# EAGLE schematic Adafruit ESP32-S3 8MB No PSRAM (EAGLE 9.6.2)
COMPANY: ADAFRUIT INDUSTRIES; DRAWN: KTOWN; REV: B
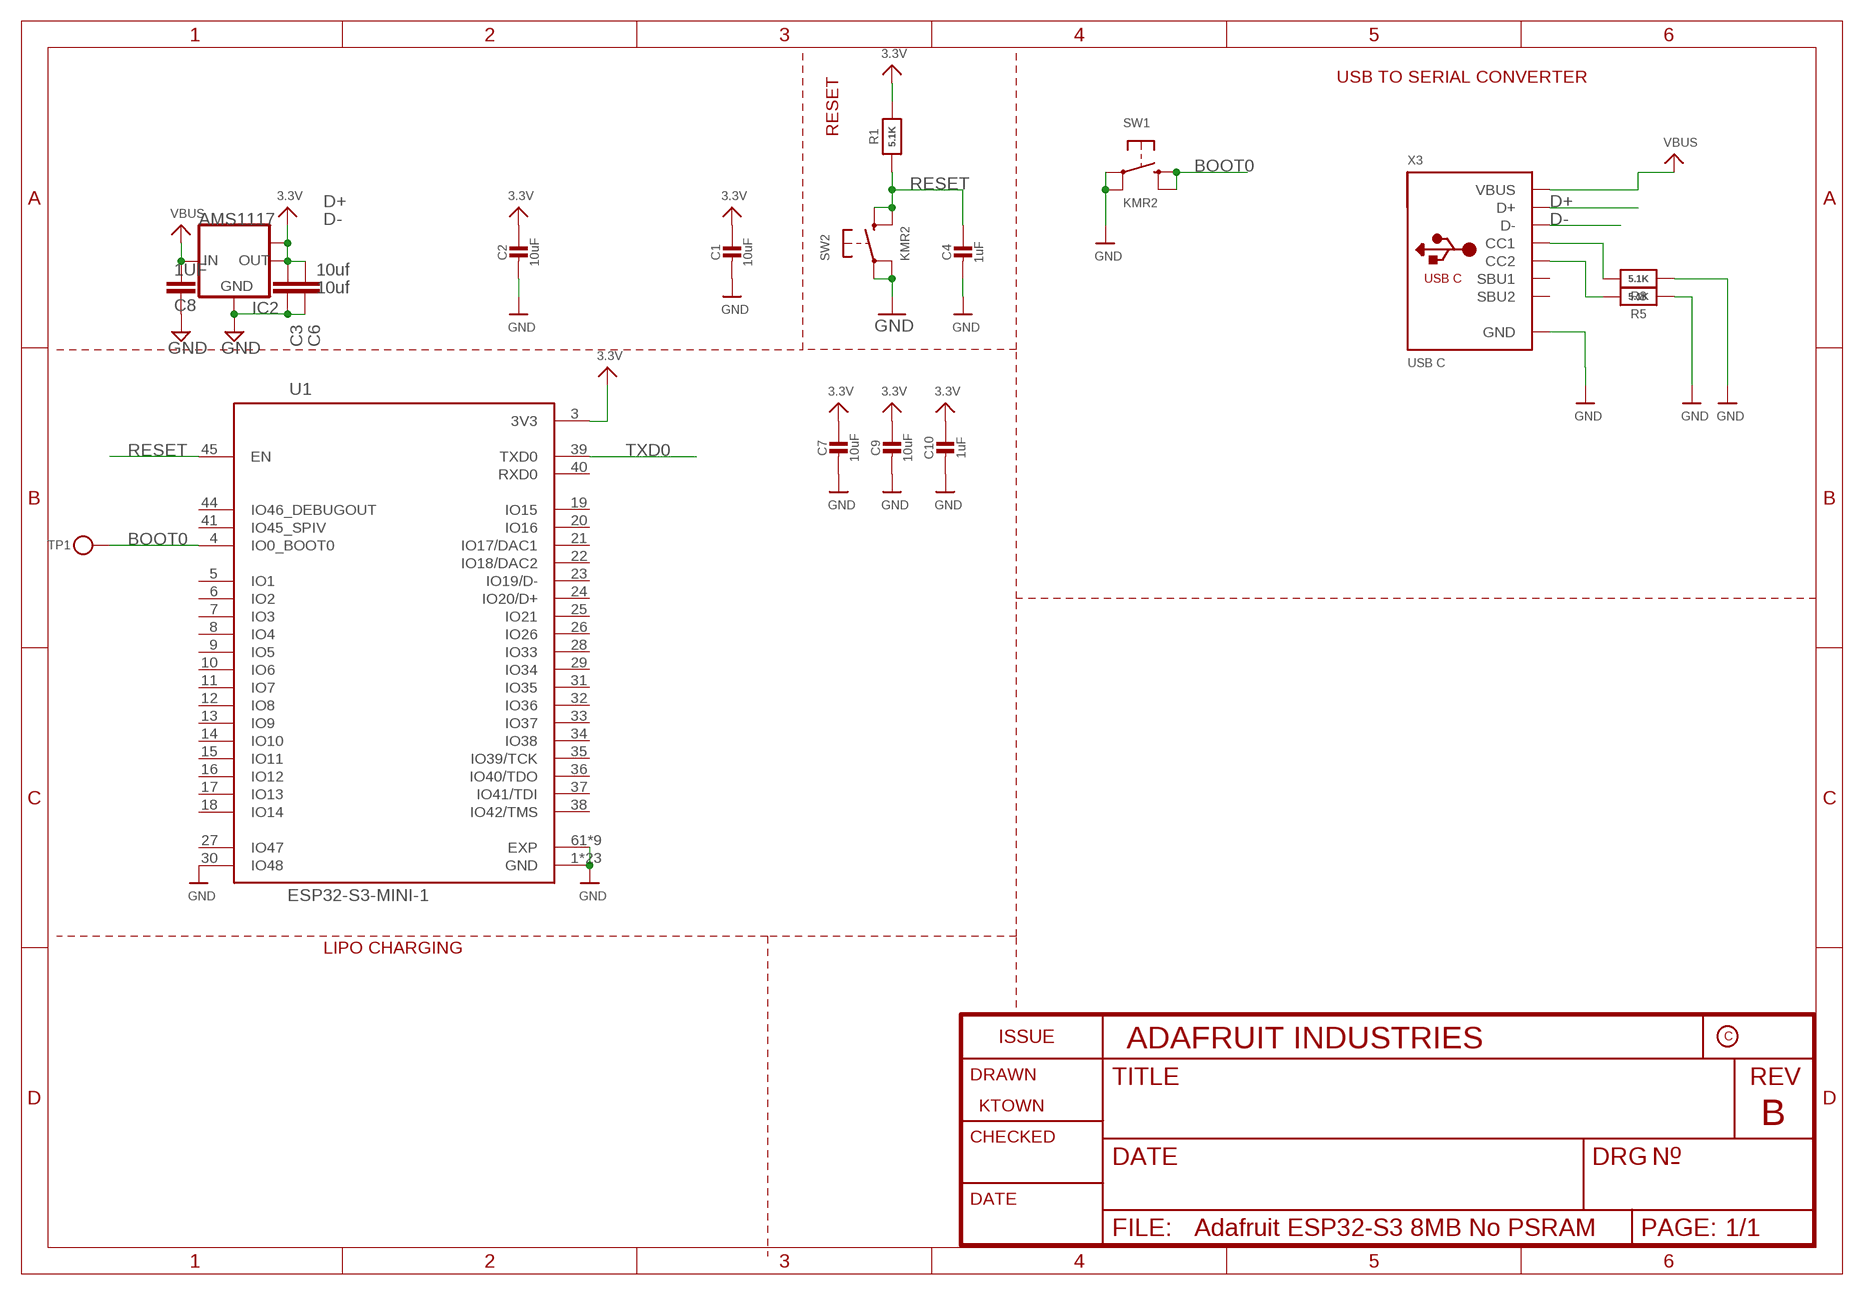
[diagram p0: schematic, sheet 1]

## Parts
C1  10uF  CAP_CERAMIC0805-NOOUTLINE  [0805-NO]
C2  10uF  CAP_CERAMIC0805-NOOUTLINE  [0805-NO]
C3  10uf  C-EUC1206K  [C1206K]
C4  1uF  CAP_CERAMIC0603_NO  [0603-NO]
C6  10uf  C-EUC1206K  [C1206K]
C7  10uF  CAP_CERAMIC0805-NOOUTLINE  [0805-NO]
C8  1UF  C-EUC1206K  [C1206K]
C9  10uF  CAP_CERAMIC0805-NOOUTLINE  [0805-NO]
C10  1uF  CAP_CERAMIC0603_NO  [0603-NO]
IC2  AMS1117  LM1117MPX-5.0  [SOT223]
R1  5.1K  RESISTOR_0603_NOOUT  [0603-NO]
R5  5.1K  RESISTOR_0603_NOOUT  [0603-NO]
R8  5.1K  RESISTOR_0603_NOOUT  [0603-NO]
SW1  KMR2  SWITCH_TACT_SMT4.6X2.8  [BTN_KMR2_4.6X2.8]
SW2  KMR2  SWITCH_TACT_SMT4.6X2.8  [BTN_KMR2_4.6X2.8]
TP1  TESTPOINTROUND1.5MMNO  [TESTPOINT_ROUND_1.5MM_NO]
U1  ESP32-S3-MINI-1  [QFN60_ESP32-S2-MINI-1_EXP]
X3  USB C  USB_C  [USB_C_CUSB31-CFM2AX-01-X]

## Nets
3.3V: C1.1 C2.1 C3.1 C6.1 C7.1 C9.1 C10.1 IC2.2(OUT) IC2.TAB(OUT1) R1.2 U1.3(3V3)
BOOT0: SW1.B'(S1) SW1.B(S) TP1.P$1 U1.4(IO0_BOOT0)
D+: X3.A6(D+) X3.B6(D+)
D-: X3.A7(D-) X3.B7(D-)
GND: C1.2 C2.2 C3.2 C4.2 C6.2 C7.2 C8.2 C9.2 C10.2 IC2.1(GND) R5.1 R8.1 SW1.A'(P1) SW1.A(P) SW2.A'(P1) SW2.A(P) U1.1(GND) U1.2(GND) U1.30(IO48) U1.42(GND) U1.43(GND) U1.46(GND) U1.47(GND) U1.48(GND) U1.49(GND) U1.50(GND) U1.51(GND) U1.52(GND) U1.53(GND) U1.54(GND) U1.55(GND) U1.56(GND) U1.57(GND) U1.58(GND) U1.59(GND) U1.60(GND) U1.61(EXP) U1.62(GND) U1.63(GND) U1.64(GND) U1.65(GND) U1.66(EXP) U1.67(EXP) U1.68(EXP) U1.69(EXP) U1.70(EXP) U1.71(EXP) U1.72(EXP) U1.73(EXP) X3.A1B12(GND) X3.B1A12(GND)
N$8: R8.2 X3.A5(CC1)
N$9: R5.2 X3.B5(CC2)
RESET: C4.1 R1.1 SW2.B'(S1) SW2.B(S) U1.45(EN)
TXD0: U1.39(TXD0)
VBUS [Power]: C8.1 IC2.3(IN) X3.A4B9(VBUS) X3.B4A9(VBUS)
Unconnected: U1.5(IO1) U1.6(IO2) U1.7(IO3) U1.8(IO4) U1.9(IO5) U1.10(IO6) U1.11(IO7) U1.12(IO8) U1.13(IO9) U1.14(IO10) U1.15(IO11) U1.16(IO12) U1.17(IO13) U1.18(IO14) U1.19(IO15) U1.20(IO16) U1.21(IO17/DAC1) U1.22(IO18/DAC2) U1.23(IO19/D-) U1.24(IO20/D+) U1.25(IO21) U1.26(IO26) U1.27(IO47) U1.28(IO33) U1.29(IO34) U1.31(IO35) U1.32(IO36) U1.33(IO37) U1.34(IO38) U1.35(IO39/TCK) U1.36(IO40/TDO) U1.37(IO41/TDI) U1.38(IO42/TMS) U1.40(RXD0) U1.41(IO45_SPIV) U1.44(IO46_DEBUGOUT) X3.A8(SBU1) X3.B8(SBU2)

## Notes on the sheet
- USB TO SERIAL CONVERTER
- RESET
- LIPO CHARGING

## Library data of the parts
C1 C2 C4 C7 C9 C10 = microbuilder:CAP_CERAMIC: Ceramic Capacitors For new designs, use the packages preceded by an '_' character since they are more reliable: The following footprints should be used on most boards: _0402 - Standard footprint for regular board layouts _0603 - Standard footprint for regular board layouts _0805 - Standard footprint for regular board layouts _1206 - Standard footprint for regular board layouts For extremely tight-pitch boards where space is at a premium, the following 'micro-pitch' footprints can be used (smaller pads, no silkscreen outline, etc.): _0402MP - Micro-pitch footprint for very dense/compact boards _0603MP - Micro-pitch footprint for very dense/compact boards _0805MP - Micro-pitch footprint for very dense/compact boards _1206MP - Micro-pitch footprint for very dense/compact boards
C3 C6 C8 = rcl:C-EU: CAPACITOR, European symbol; SPICEPREFIX: C
IC2 = lm1117:LM1117MPX-*
R1 R5 R8 = microbuilder:RESISTOR: Resistors For new designs, use the packages preceded by an '_' character since they are more reliable: The following footprints should be used on most boards: _0402 - Standard footprint for regular board layouts _0603 - Standard footprint for regular board layouts _0805 - Standard footprint for regular board layouts _1206 - Standard footprint for regular board layouts For extremely tight-pitch boards where space is at a premium, the following 'micro-pitch' footprints can be used (smaller pads, no silkscreen outline, etc.): _0402MP - Micro-pitch footprint for very dense/compact boards _0603MP - Micro-pitch footprint for very dense/compact boards _0805MP - Micro-pitch footprint for very dense/compact boards _1206MP - Micro-pitch footprint for very dense/compact boards
SW1 SW2 = microbuilder:SWITCH_TACT_SMT: SMT Tact Switches 6x6mm - Digikey: P12940SCT-ND KMR2 (4.6x2.8mm) - Digikey: 401-1426-1-ND EVQ-PQHB55 - Light Touch, 160GF (4.5x4.5mm) - Digikey: P8090SCT-ND KMT0 - KMT021 NGJ LHS (etc.) IP68/Waterproof - Digikey: CKN10289CT-ND
TP1 = microbuilder:TESTPOINT: Test Point Various test points for characterisation and PCB testing TESTPOINT_SMT - Compact Surface Mount Test Point [Digikey: 5016KTR-ND]
U1 = adafruit_wireless:ESP32-S3-MINI-1; BUILT_BY: EMA_Kyle; COPYRIGHT: Copyright (C) 2018 Accelerated Designs. All rights reserved; DATASHEET: https://www.espressif.com/sites/default/files/documentation/esp32-s2-mini-1_esp32-s2-mini-1u_datasheet_en.pdf; MANUFACTURER_PART_NUMBER: ESP32-S2-MINI-1; SOURCELIBRARY: Add_to_database_2020-11-03; VENDOR: Espressif Systems
X3 = adafruit_connector:USB_C: USB Type-C USB 2.0 Connector

## Net classes
2 gnd: width 0.254 mm, drill 0.483 mm
3 Power: width 0.305 mm, drill 0.483 mm